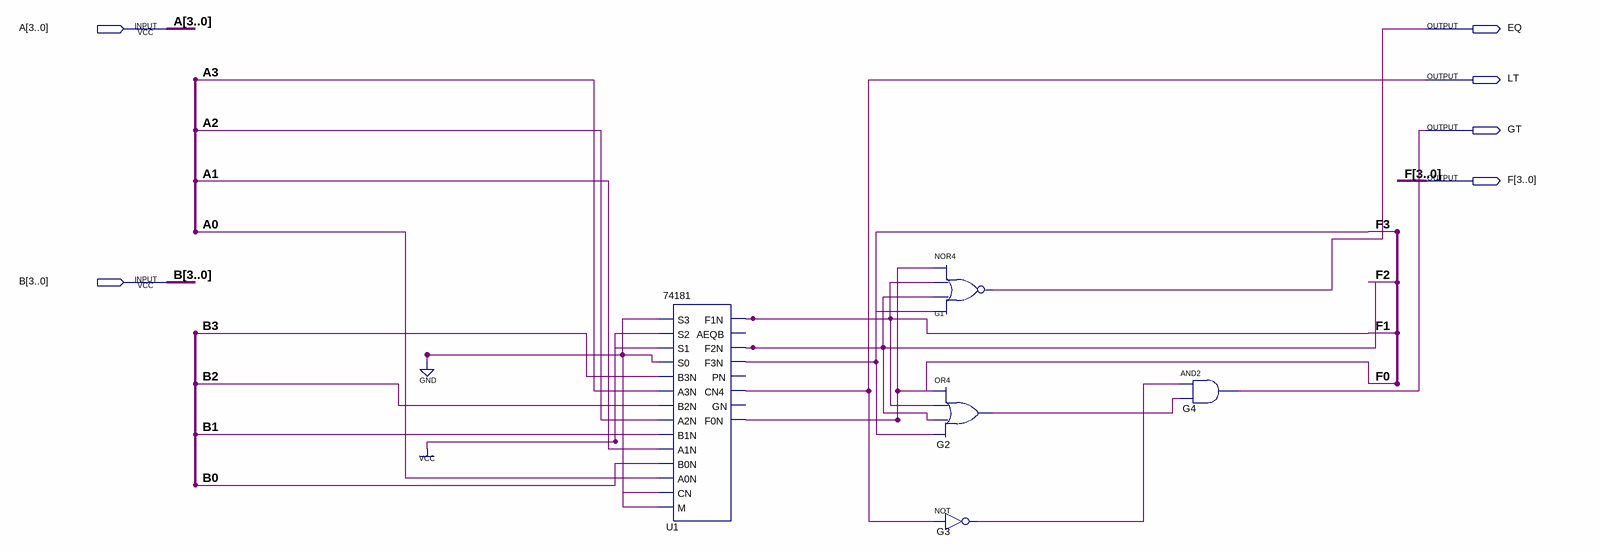
[diagram p0: schematic sheet]
// Quartus schematic cmp4.bdf as structural Verilog: 5 symbols, 6 pins
module cmp4 (
  input  [3:0] A,
  input  [3:0] B,
  output EQ,
  output LT,
  output GT,
  output [3:0] F
);

  wire G2_out, G3_out;

  \74181  U1 (
    .S3(1'b0), .S2(1'b1), .S1(1'b1), .S0(1'b0), .B3N(B[3]), .A3N(A[3]), .B2N(B[2]), .A2N(A[2]), .B1N(B[1]),
    .A1N(A[1]), .B0N(B[0]), .A0N(A[0]), .CN(1'b0), .M(1'b0), .F1N(F[1]), .F2N(F[2]), .F3N(F[3]), .CN4(LT),
    .F0N(F[0]));  // open: AEQB, PN, GN
  nor G1 (EQ, F[0], F[1], F[2], F[3]);
  or G2 (G2_out, F[0], F[1], F[2], F[3]);
  not G3 (G3_out, LT);
  and G4 (GT, G3_out, G2_out);
endmodule
